# EAGLE design Magnetic Switch (EAGLE 9.6.2)
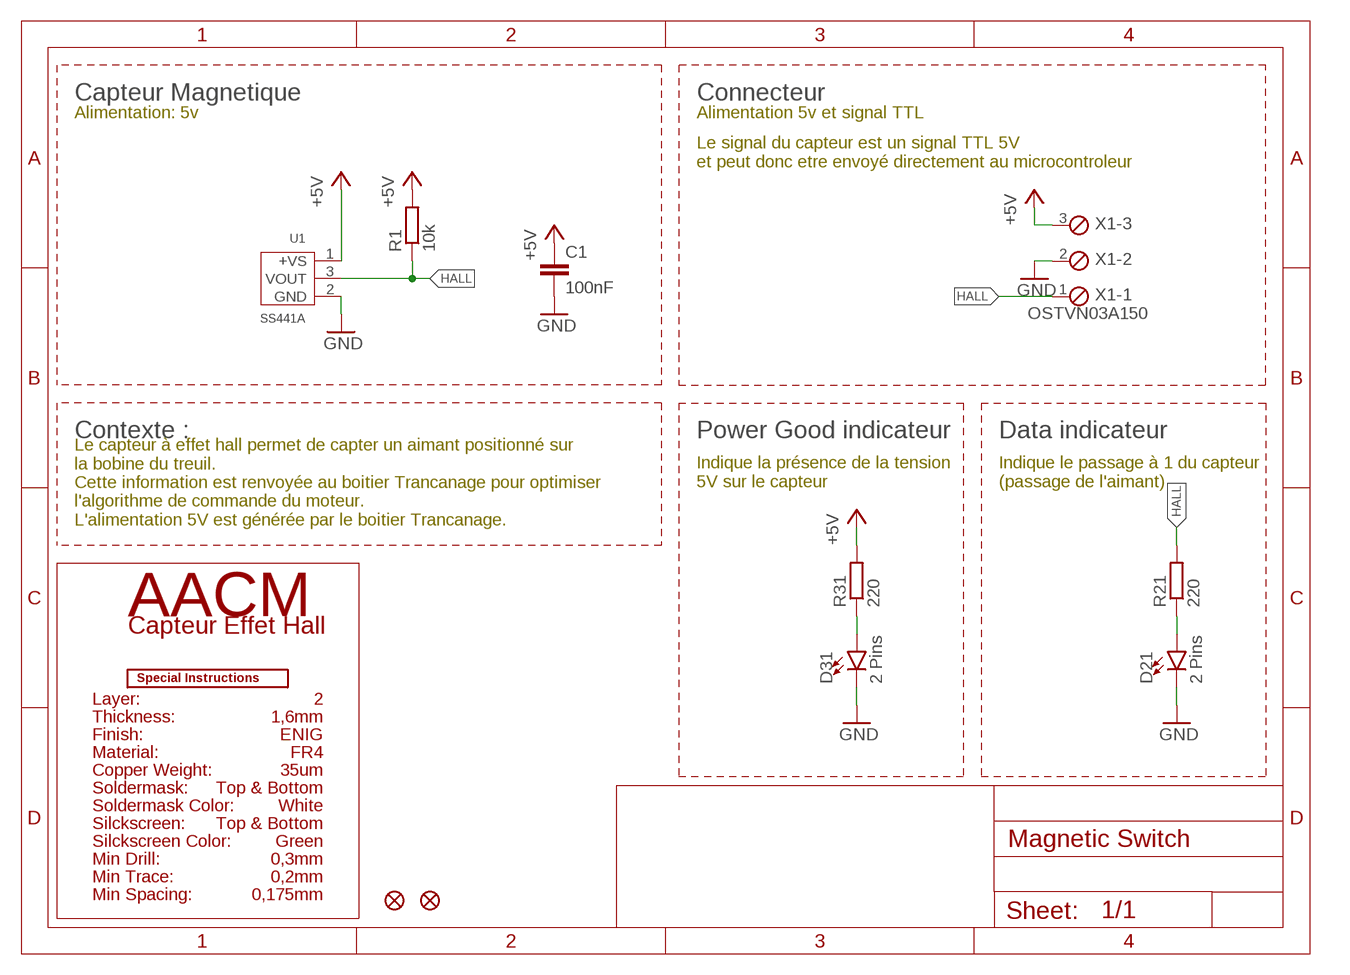
[diagram p0: schematic, sheet 1]

## Parts
C1  100nF  C-EUC0603  [C0603]
D21  2 Pins  LED3MM  [LED_3MM]
D31  2 Pins  LED3MM  [LED_3MM]
FD1  FIDUCIALUFIDUCIAL  [FIDUCIAL-MICRO]
FD2  FIDUCIALUFIDUCIAL  [FIDUCIAL-MICRO]
R1  10k  R-EU_R0603  [R0603]
R21  220  R-EU_R0603  [R0603]
R31  220  R-EU_R0603  [R0603]
U1  SS441A  SS441  [TO-92-3]
U$1  SPECIAL_INSTRUCTIONS-PRODUCTION  [PRODUCTION_INSTRUCTIONS]
X1  OSTVN03A150  MPT3  [3POL254]

## Nets
+5V: C1.1 R1.2 R31.2 U1.1(+VS) X1.3
DIODED21: D21.A R21.1
DIODED31: D31.A R31.1
GND: C1.2 D21.K(C) D31.K(C) U1.2(GND) X1.2
HALL: R1.1 R21.2 U1.3(VOUT) X1.1

## Notes on the sheet
- Capteur Magnetique | Connecteur
- Alimentation: 5v | Alimentation 5v et signal TTL
- Le signal du capteur est un signal TTL 5V
  et peut donc etre envoyé directement au microcontroleur
- Le capteur à effet hall permet de capter un aimant positionné sur
  la bobine du treuil.
  Cette information est renvoyée au boitier Trancanage pour optimiser 
  l'algorithme de commande du moteur.
  L'alimentation 5V est générée par le boitier Trancanage.
- Contexte : | Power Good indicateur | Data indicateur
- Indique la présence de la tension 
  5V sur le capteur
- Indique le passage à 1 du capteur 
  (passage de l'aimant)
- AACM
- Capteur Effet Hall
- Layer: | 2
- Thickness: | 1,6mm
- Finish: | ENIG
- Material: | FR4
- Copper Weight: | 35um
- Soldermask: | Top & Bottom
- Soldermask Color: | White
- Silckscreen: | Top & Bottom
- Silckscreen Color: | Green
- Min Drill: | 0,3mm
- Min Trace: | 0,2mm
- Min Spacing: | 0,175mm

## Library data of the parts
C1 = rcl:C-EU: CAPACITOR, European symbol; SPICEPREFIX: C
D21 D31 = SparkFun-LED:LED: LED (Generic) Standard schematic elements and footprints for 5mm, 3mm, 1206, and 0603 sized LEDs. Generic LEDs with no color specified.; PROD_ID: DIO-08794
FD1 FD2 = SparkFun-Aesthetics:FIDUCIAL: Fiducial Alignment Points Point-of-reference for pick-and-place machines and other optical instruments.
R1 R21 R31 = rcl:R-EU_: RESISTOR, European symbol; SPICEPREFIX: R
U1 = SS441:SS441: 314010011; MPN: SS441; VALUE: SS441
U$1 = SparkFun-Aesthetics:SPECIAL_INSTRUCTIONS: Special Ordering/Production Instructions Alert Symbol for special PCB ordering instructions or unique production process warnings. Ordering Instructions Production Instructions Types of information that should be added to box: Copper weight Soldermask color Silk color PCB thickness Number of layers PCB Standard: 1.6mm FR4 1 oz copper immersion silver plating red soldermask white silkscreen Types of information that should be added to box: Special wash requirements Depaneling instructions Humidification Glue curing Default text settings: 0.07 inch 9% ratio 50% line distance
X1 = con-phoenix-254:MPT3: PHOENIX CONNECTOR; OC_FARNELL: unknown; OC_NEWARK: unknown

## Board
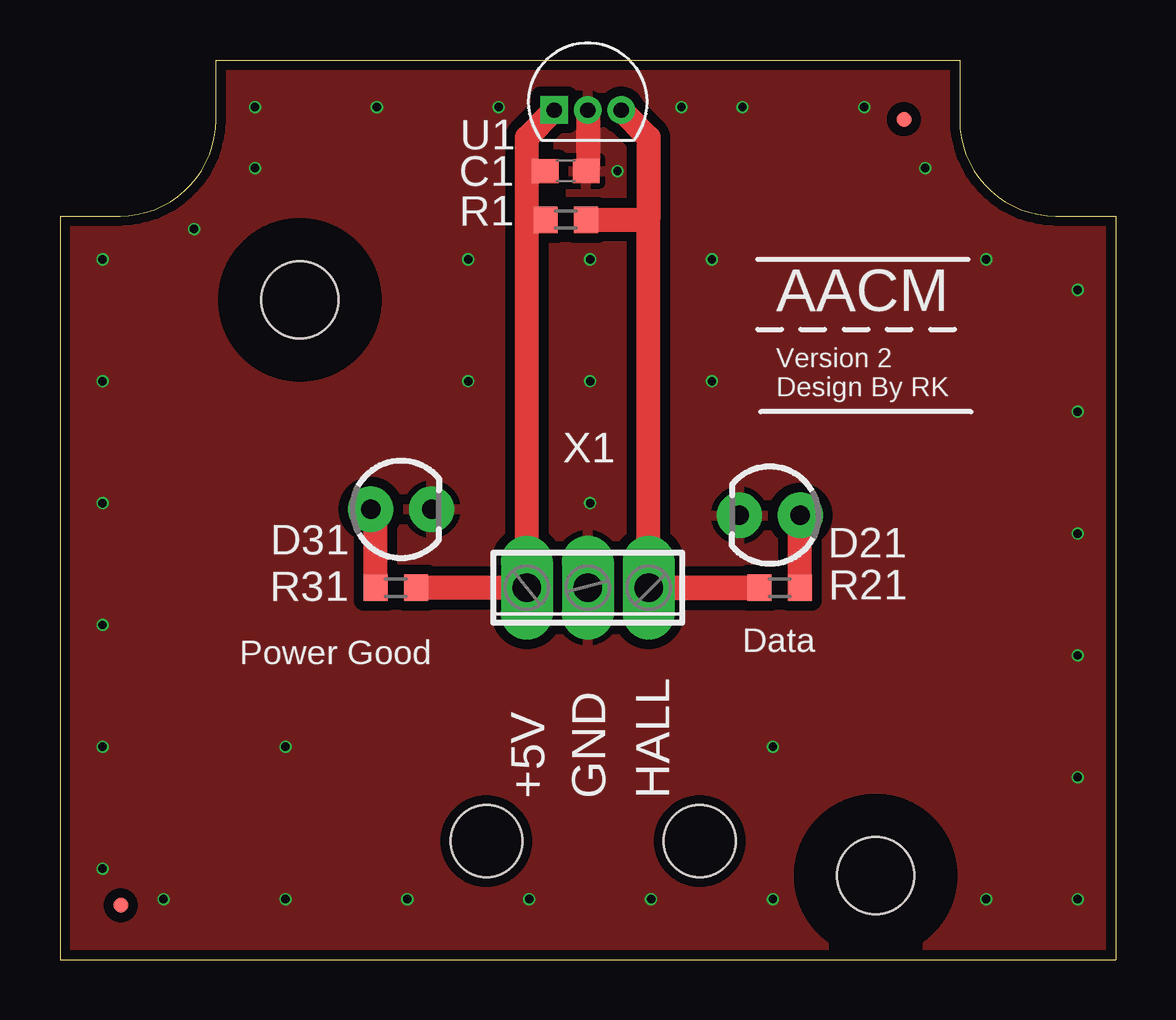
[diagram p1: board, top side]
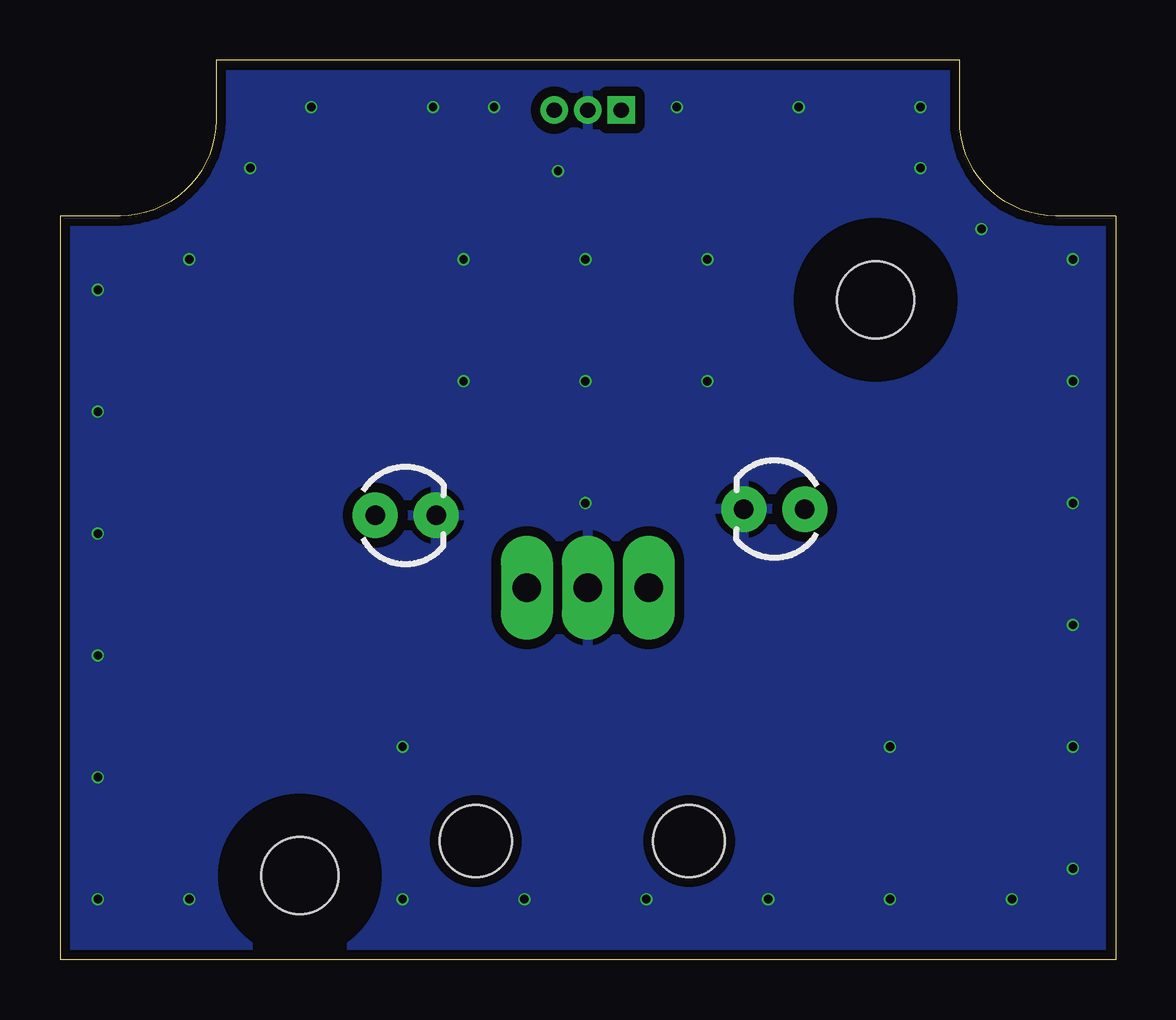
[diagram p2: board, bottom side, seen from below]

Size 44 x 37.5 mm. Coordinates in mm from the lower left corner, seen from the top.
Outline: 0,31 0,0 44,0 44,31 41.5,31 arc-90 37.5,35 37.5,37.5 6.5,37.5 6.5,35 arc-90 2.5,31 0,31
Copper layers (1*16): Top 0.035mm / dielectric 1.6mm / Bottom 0.035mm
Design rules "jlcpcb-2layers *": minimum track width 5mil, minimum drill 0.3mm, track to track 5mil, track to pad 5mil, pad to pad 5mil, via to via 5mil, smd to smd 5mil, copper to edge 0.2mm, drill to drill 6mil, minimum pad ring 10mil, minimum via ring 3mil, stop-mask expansion 13mil, vias tented up to drill 14mil, thermal gap 10mil
Holes 3.2 mm at 10,27.5 34,3.5
Holes 3 mm at 17.78,4.93 26.67,4.93
tKeepout: area 31,0.5 to 37,6.5
tRestrict: area 31,0.5 to 37,6.5; area 7,24.5 to 13,30.5
bRestrict: area 7,24.5 to 13,30.5; area 31,0.5 to 37,6.5
vRestrict: area 16.6,5.6 to 18.9,6.3

### Footprints (pad centres in the part's own frame; a part is rotated, then mirrored left to right if it is on the bottom)
C0603 = smd 1.1 x 1: 1 -0.85,0; 2 0.85,0
LED_3MM = drill 0.813 pad 1.88: A -1.27,0; K 1.27,0
FIDUCIAL-MICRO = smd 0.635 x 0.635: 1 0,0
R0603 = smd 1 x 1.1: 1 -0.85,0; 2 0.85,0
TO-92-3 = drill 0.635 pad 1.143 square: 1 -1.397,0 | drill 0.635 pad 1.143: 2 0,0; 3 1.397,0
3POL254 = drill 1.2 long: 1 -2.54,0; 2 0,0; 3 2.54,0

### Placement (x,y rotation side)
C1  21.08,32.87 0 top
D21  29.59,18.52 180 top
D31  14.22,18.77 0 top
FD1  2.54,2.26 0 top
FD2  35.18,35.03 0 top
R1  21.08,30.84 180 top
R21  30,15.5 180 top
R31  14,15.5 0 top
U1  22,35.41 0 top
U$1  57.53,44.68 0 top  (outside the outline)
X1  22,15.5 180 top

### Tracks (layer width: path | path; a pad name or v marks a point on that pad's centre or on a via)
+5V
  Top 1: 19.46,30.84 X1.3 R31.2 | 19.46,30.84 19.46,32.87 | 19.46,32.87 19.46,34.27 U1.1 | R1.2 19.46,30.84 | C1.1 19.46,32.87
DIODED21
  Top 1: D21.A 30.85,18.51 R21.1
DIODED31
  Top 1: R31.1 13.15,18.58 D31.A
GND  (via drill 0.35)
  Top 1: U1.2 22,32.94 C1.2
  other vias: 1.78,29.19 1.78,24.11 1.78,19.03 1.78,13.95 1.78,8.87 1.78,3.79 4.32,2.52 9.4,2.52 14.48,2.52 19.56,2.52 24.64,2.52 29.72,2.52 38.61,2.52 42.42,2.52 42.42,7.6 42.42,12.68 42.42,17.76 42.42,22.84 42.42,27.92 38.61,29.19 36.07,33 33.53,35.54 28.45,35.54 8.13,35.54 13.21,35.54 18.29,35.54 25.91,35.54 8.13,33 5.59,30.46 22.1,29.19 22.1,24.11 22.1,19.03 17.02,29.19 17.02,24.11 27.18,24.11 27.18,29.19 9.4,8.87 29.72,8.87 23.24,32.87
  pour Top (isolate 0.406, rank 6): 0,39.22 45.72,39.22 45.72,-6.5 0,-6.5
  pour Bottom (isolate 0.406): 0,37.95 44.45,37.95 44.45,-6.5 0,-6.5
HALL
  Top 1: X1.1 24.54,30.97 | 24.54,30.97 24.54,34.27 U1.3 | R1.1 24.41,30.84 24.54,30.97
  Top 1.016: X1.1 R21.2

### Text on the board
tNames: AACM | Version 2 / Design By RK | Power Good | Data | +5V | GND | HALL
tDocu: Le capteur U1 doit etre cablé avec de la marge sur la hauteur. / En effet le capteur doit etre plaqué contre la mécanique dans le trou prévu à cet effet / (voir plan mécanique)